# Altium schematic sheet 02_MCU_ESP32_WROOM.SchDoc
size 420 x 297 mm; SheetNumber: 3; SheetTotal: 3
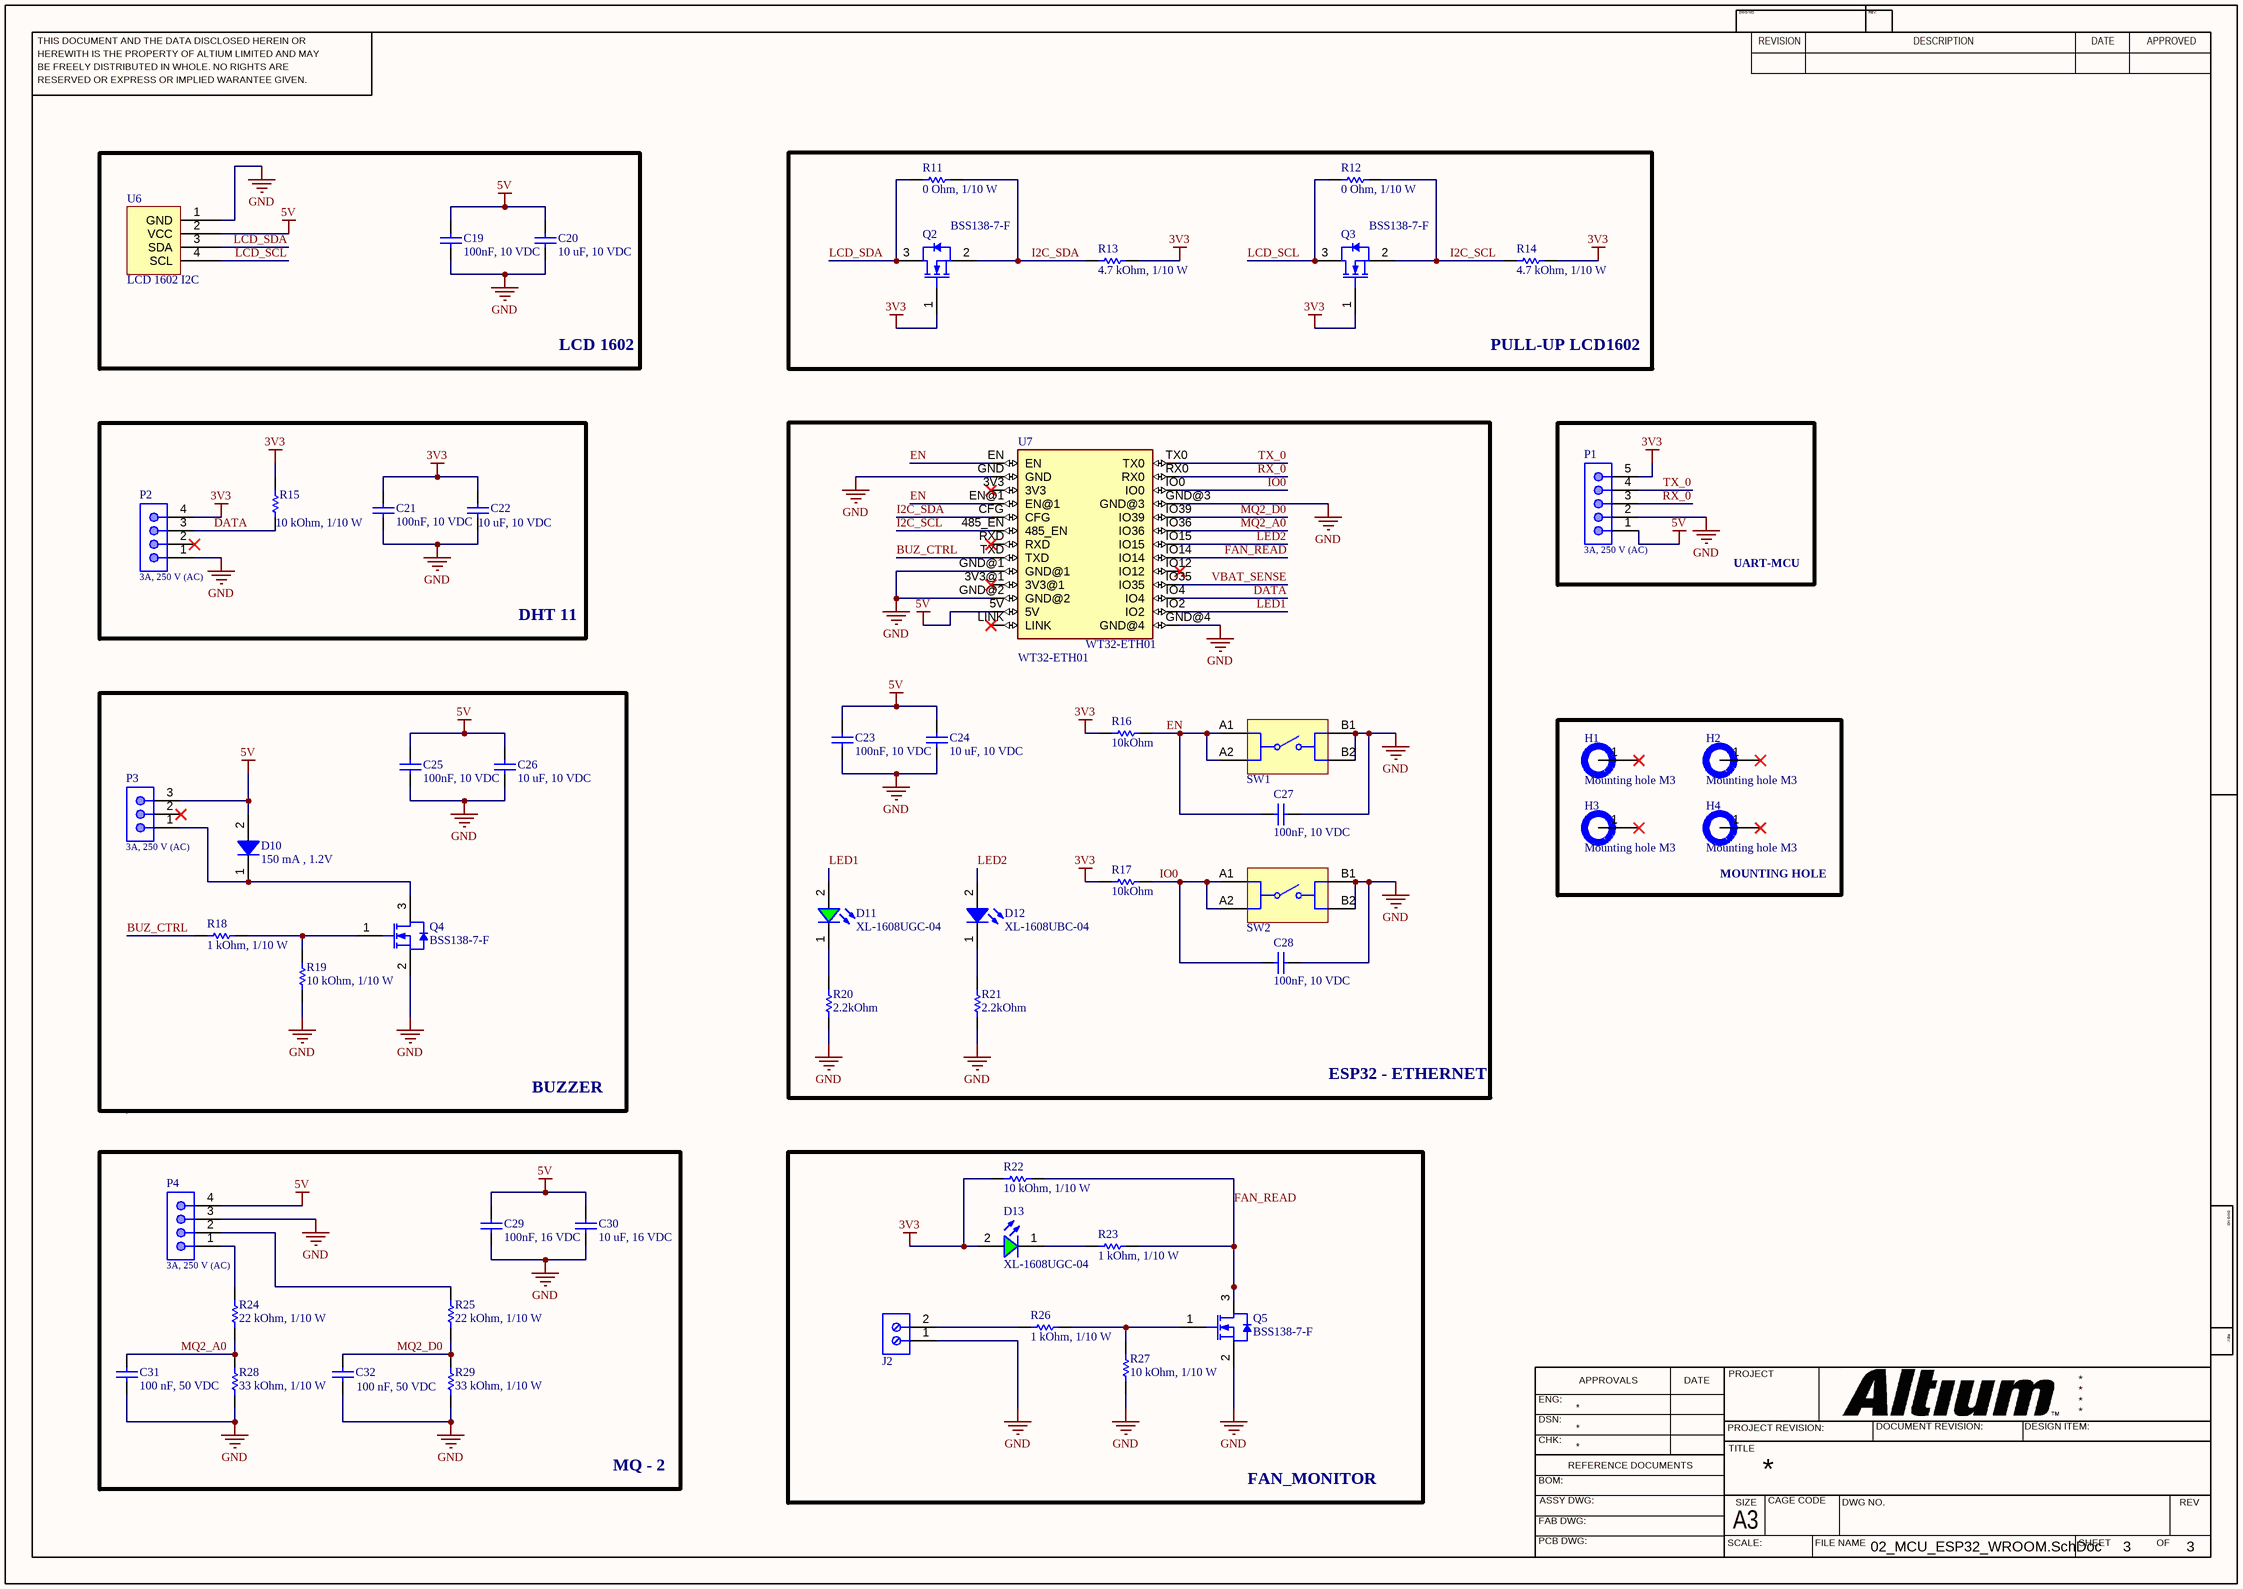
[diagram p0: 02_MCU_ESP32_WROOM.SchDoc]

## Parts
C19  100nF, 10 VDC  [CAP_0603]
C20  10 uF, 10 VDC  [CAP_0603]
C21  100nF, 10 VDC  [CAP_0603]
C22  10 uF, 10 VDC  [CAP_0603]
C23  100nF, 10 VDC  [CAP_0603]
C24  10 uF, 10 VDC  [CAP_0603]
C25  100nF, 10 VDC  [CAP_0603]
C26  10 uF, 10 VDC  [CAP_0603]
C27  100nF, 10 VDC  [CAP_0603]
C28  100nF, 10 VDC  [CAP_0603]
C29  100nF, 16 VDC  [CAP_0603]
C30  10 uF, 16 VDC  [CAP_0603]
C31  100 nF, 50 VDC  [CAP_0603]
C32  100 nF, 50 VDC  [CAP_0603]
D10  150 mA , 1.2V  [SOD-123]
D11  XL-1608UGC-04  [WL-SMCW_0603_H=0.7mm]
D12  XL-1608UBC-04  [WL-SMCW_0603_H=0.7mm]
D13  XL-1608UGC-04  [WL-SMCW_0603_H=0.7mm]
H1  Mounting hole M3  [Mounting hole M3]
H2  Mounting hole M3  [Mounting hole M3]
H3  Mounting hole M3  [Mounting hole M3]
H4  Mounting hole M3  [Mounting hole M3]
J2  6A, 150V  [691210910002]  (value not drawn)
P1  3A, 250 V (AC)  [61300511021]
P2  3A, 250 V (AC)  [61300411021]
P3  3A, 250 V (AC)  [61300311021]
P4  3A, 250 V (AC)  [61300411021]
Q2  BSS138-7-F  [BSS138-7-F-SOT23]
Q3  BSS138-7-F  [BSS138-7-F-SOT23]
Q4  BSS138-7-F  [BSS138-7-F-SOT23]
Q5  BSS138-7-F  [BSS138-7-F-SOT23]
R11  0 Ohm, 1/10 W  [RES_0603]
R12  0 Ohm, 1/10 W  [RES_0603]
R13  4.7 kOhm, 1/10 W  [RES_0603]
R14  4.7 kOhm, 1/10 W  [RES_0603]
R15  10 kOhm, 1/10 W  [RES_0603]
R16  10kOhm  [RES_0603]
R17  10kOhm  [RES_0603]
R18  1 kOhm, 1/10 W  [RES_0603]
R19  10 kOhm, 1/10 W  [RES_0603]
R20  2.2kOhm  [RES_0603]
R21  2.2kOhm  [RES_0603]
R22  10 kOhm, 1/10 W  [RES_0603]
R23  1 kOhm, 1/10 W  [RES_0603]
R24  22 kOhm, 1/10 W  [RES_0603]
R25  22 kOhm, 1/10 W  [RES_0603]
R26  1 kOhm, 1/10 W  [RES_0603]
R27  10 kOhm, 1/10 W  [RES_0603]
R28  33 kOhm, 1/10 W  [RES_0603]
R29  33 kOhm, 1/10 W  [RES_0603]
SW1  430152043826  [WS-TASV_L6W6H4.3_4301x20438x6]  (value not drawn)
SW2  430152043826  [WS-TASV_L6W6H4.3_4301x20438x6]  (value not drawn)
U6  LCD 1602 I2C  [*KK2_54X4]
U7  WT32-ETH01  [WT32-ETH01]

## Blocks framed on the sheet
LCD 1602: C19 C20 U6
PULL-UP LCD1602: Q2 Q3 R11-R14
DHT 11: C21 C22 P2 R15
ESP32 - ETHERNET: C23 C24 C27 C28 D11 D12 R16 R17 R20 R21 SW1 SW2 U7
UART-MCU: P1
BUZZER: C25 C26 D10 P3 Q4 R18 R19
MOUNTING HOLE: H1-H4
MQ - 2: C29-C32 P4 R24 R25 R28 R29
FAN_MONITOR: D13 J2 Q5 R22 R23 R26 R27

## Nets
3V3: C21.2 C22.2 D13.2(A) P1.5 P2.4 Q2.1(G) Q3.1(G) R13.1 R14.1 R15.2 R16.1 R17.1 R22.2
5V: C19.2 C20.2 C23.2 C24.2 C25.2 C26.2 C29.2 C30.2 D10.2(A) P1.1 P3.3 P4.4 U6.2(VCC) U7.5V
GND: C19.1 C20.1 C21.1 C22.1 C23.1 C24.1 C25.1 C26.1 C27.1 C28.1 C29.1 C30.1 C31.1 C32.1 J2.1 P1.2 P2.1 P4.3 Q4.2(S) Q5.2(S) R19.1 R20.2 R21.2 R27.1 R28.1 R29.1 SW1.B1 SW1.B2 SW2.B1 SW2.B2 U6.1(GND) U7.GND U7.GND@1 U7.GND@2 U7.GND@3 U7.GND@4
BUZ_CTRL: R18.1 U7.TXD
DATA: P2.3 R15.1 U7.IO4
EN: C27.2 R16.2 SW1.A1 SW1.A2 U7.EN U7.EN@1
FAN_READ: Q5.3(D) R22.1 R23.1 U7.IO14
I2C_SCL: Q3.2(S) R12.2 R14.2 U7.485_EN
I2C_SDA: Q2.2(S) R11.2 R13.2 U7.CFG
IO0: C28.2 R17.2 SW2.A1 SW2.A2 U7.IO0
LCD_SCL: Q3.3(D) R12.1 U6.4(SCL)
LCD_SDA: Q2.3(D) R11.1 U6.3(SDA)
LED1: D11.2(A) U7.IO2
LED2: D12.2(A) U7.IO15
MQ2_A0: C31.2 R24.2 R28.2 U7.IO36
MQ2_D0: C32.2 R25.1 R29.2 U7.IO39
RX_0: P1.3 U7.RX0
TX_0: P1.4 U7.TX0
VBAT_SENSE: U7.IO35
NetD10_1: D10.1(K) P3.1 Q4.3(D)
NetD11_1: D11.1(K) R20.1
NetD12_1: D12.1(K) R21.1
NetD13_1: D13.1(K) R23.2
NetJ2_2: J2.2 R26.1
NetP4_1: P4.1 R24.1
NetP4_2: P4.2 R25.2
NetQ4_1: Q4.1(G) R18.2 R19.2
NetQ5_1: Q5.1(G) R26.2 R27.2

Not connected (* = marked no-connect by the designer): H1 1*; H2 1*; H3 1*; H4 1*; P2 2*; P3 2*; U7 3V3* 3V3@1* IO12* LINK* RXD*

## Notes on the sheet
- THIS DOCUMENT AND THE DATA DISCLOSED HEREIN OR
- HEREWITH IS THE PROPERTY OF ALTIUM LIMITED AND MAY
- DWG NO:
- REVISION
- REV:
- DESCRIPTION
- DATE
- APPROVED
- BE FREELY DISTRIBUTED IN WHOLE. NO RIGHTS ARE
- RESERVED OR EXPRESS OR IMPLIED WARANTEE GIVEN.
- ENG:
- APPROVALS
- PROJECT
- DSN:
- CHK:
- REFERENCE DOCUMENTS
- PROJECT REVISION:
- TITLE
- DOCUMENT REVISION:
- DESIGN ITEM:
- BOM:
- FAB DWG:
- PCB DWG:
- ASSY DWG:
- SCALE:
- A3
- SIZE
- CAGE CODE
- FILE NAME
- DWG NO.
- SHEET
- OF
- REV

## Library data of the parts
C19-C30 = 0106031061010: CAP, size 0603, 10 uF, 10 VDC, 10%; Manufacturer: Samsung Electro-Mechanics; Manufacturer Part Number: CL10A106KP8NNNC; Capacitance: 10 uF; Tolerance: +/-10%; Voltage Rating DC: 10 VDC; Value: 10 uF; Packaging: Tape and Reel; Supplier 1 URL: https://www.mouser.vn/ProductDetail/Samsung-Electro-Mechanics/CL10A106KP8NNNC?qs=X6jEic%2FHinAlyfRHj7fKwg%3D%3D; Supplier 2 URL: https://www.digikey.com/en/products/detail/samsung-electro-mechanics/cl10a106kp8nnnc/3886850; Supplier 3 URL: https://www.thegioiic.com/tu-gom-0603-10uf-25v; Supplier 1: Mouser; Supplier 1 Part Number: 187-CL10A106KP8NNNC; Supplier 2: Digi-Key; Supplier 2 Part Number: 1276-1192-2-ND; Supplier 3: thegioiic; Supplier 3 Part Number: N/A; ComponentLink1Description: Datasheet; ComponentLink1URL: https://www.mouser.vn/datasheet/2/585/MLCC-1837944.pdf; Mount: SMD/SMT; Operating Temperature Max: + 85 C; Operating Temperature Min: - 40 C; Package / Case: 0603; LCSC Part #: C19702
C31 C32 = 0106031041050: CAP, size 0603, 100 nF, 50 VDC, 10%; Manufacturer: TDK; Manufacturer Part Number: CGA3E3X8R1H104K080AE; Capacitance: 100 nF; Tolerance: +/-10%; Voltage Rating DC: 50 VDC; Value: 100 nF; Packaging: Tape and Reel; Supplier 1 URL: https://www.mouser.com/ProductDetail/TDK/CGA3E3X8R1H104K080AE?qs=nQSIdc08i%252Bd8g3IRRgU2bw%3D%3D&utm_source=mouser-refine-download&utm_medium=file&utm_campaign=CGA3E3X8R1H104K080AE&utm_content=TDK; Supplier 2 URL: https://www.digikey.com/en/products/detail/tdk-corporation/cga3e3x8r1h104k080ae/5809262; Supplier 3 URL: https://www.thegioiic.com/tu-gom-0603-100nf-0-1uf-50v; Supplier 1: Mouser; Supplier 1 Part Number: 810-CGA3E3X8R1H104KA; Supplier 2: Digi-Key; Supplier 2 Part Number: 445-173697-2-ND; Supplier 3: thegioiic; Supplier 3 Part Number: N/A; ComponentLink1Description: Datasheet; ComponentLink1URL: https://product.tdk.com/system/files/dam/doc/product/capacitor/ceramic/mlcc/catalog/mlcc_automotive_soft_en.pdf?ref_disty=mouser; Mount: SMD/SMT; Operating Temperature Max: + 85 C; Operating Temperature Min: - 40 C; Package / Case: 0603; LCSC Part #: C14663
D10 = 1N4148W-E3-18: Diodes - General Purpose, Power, Switching 100 Volt 500mA 4ns; Manufacturer: Vishay Semiconductors; Type: Rectifiers; Forward Current: 150 mA; Maximum Diode Capacitance: 4 pF; Max Surge Current: 2 A; Peak Reverse Voltage: 100 V; Power Dissipation: 350 mW; Reverse Current: 5 uA; Supplier 1 URL: https://www.mouser.vn/ProductDetail/Vishay-Semiconductors/1N4148W-E3-18?qs=bTzheeSci6Q3YaBSBujcdg%3D%3D; Supplier 2 URL: https://www.digikey.com/en/products/detail/vishay-general-semiconductor-diodes-division/1n4148w-e3-18/3104163; Supplier 3 URL: https://www.thegioiic.com/1n4148w-e3-18-diode-gen-purp-75v-150ma-sod123; Value: 150 mA , 1.2V; Forward Voltage: 1.2 V; Recovery Time: 4 ns; Manufacturer Part Number: 1N4148W-E3-18; Supplier 1: Mouser; Supplier 1 Part Number: 78-1N4148W-E3-18; Supplier 2: Digi-Key; Supplier 2 Part Number: 1N4148W-E3-18TR-ND; Supplier 3: thegioiic; Supplier 3 Part Number: 1N4148W-E3-18; Mount: SMD/SMT; Operating Temperature Max: + 85 C; Operating Temperature Min: - 40 C; Package / Case: SOD-123; ComponentLink1Description: Datasheet; ComponentLink1URL: https://www.vishay.com/doc?85748; Packaging: Tape and Reel; LCSC Part #: N/A
D11 D13 = XL-1608UGC-04: Emerald Green 525nm LED Indication - Discrete 3.3V 0603; Manufacturer: XINGLIGHT; Type: Clear; Color: Green; ComponentLink1Description: Datasheet; ComponentLink1URL: https://www.lcsc.com/datasheet/C965807.pdf; Supplier 1 URL: N/A; Supplier 2 URL: N/A; Supplier 3 URL: https://www.thegioiic.com/led-xanh-la-0603-dan-smd-trong-suot; Value: XL-1608UGC-04; Mount: SMD/SMT; Operating Temperature Max: + 85 C; Operating Temperature Min: - 40 C; Package / Case: 0603; Packaging: Tape and Reel; Supplier 1: Mouser; Supplier 1 Part Number: N/A; Supplier 2: Digi-Key; Supplier 2 Part Number: N/A; Supplier 3: thegioiic; Supplier 3 Part Number: N/A; LCSC Part #: C965804; Manufacturer Part Number: XL-1608UGC-04
D12 = XL-1608UBC-04: Blue 470nm LED Indication - Discrete 3.3V 0603; Manufacturer: XINGLIGHT; Type: Clear; Color: Blue; ComponentLink1Description: Datasheet; ComponentLink1URL: https://www.lcsc.com/datasheet/C965807.pdf; Supplier 1 URL: N/A; Supplier 2 URL: N/A; Supplier 3 URL: https://www.thegioiic.com/led-xanh-duong-0603-dan-smd-trong-suot; Value: XL-1608UBC-04; Manufacturer Part Number: XL-1608UBC-04; Mount: SMD/SMT; Operating Temperature Max: + 85 C; Operating Temperature Min: - 40 C; Package / Case: 0603; Packaging: Tape and Reel; Supplier 1: Mouser; Supplier 1 Part Number: N/A; Supplier 2: Digi-Key; Supplier 2 Part Number: N/A; Supplier 3: thegioiic; Supplier 3 Part Number: N/A; LCSC Part #: C965807
J2 = 691210910002: WR-TBL Series 2109 Horizontal Entry, THT, pitch 2.54mm, 2p; Manufacturer: Wurth Elektronik; Modularity: No; ComponentLink1Description: Datasheet; ComponentLink1URL: https://www.we-online.com/redexpert/spec/691210910002?ad; Manufacturer Part Number: 691210910002; Category: Terminal Blocks; Match Code: WR-TBL; Mount: Through Hole; Operating Temperature Max: 105°C; Operating Temperature Min: -40°C; Packaging: Box; Application: Rising Cage Clamp; Number of Pins: 2; Number of Rows: 1; Orientation: Horizontal; Pitch: 2.54mm; Rated Current: 6A; Working Voltage: 150V; Supplier 1 URL: N/A; Supplier 2 URL: N/A; Supplier 3 URL: https://www.thegioiic.com/kf128-2-v-domino-2-chan-thang-2-54mm-150v-6a-han-pcb; Value: 6A, 150V; LCSC Part #: N/A; Supplier 1: Mouser; Supplier 1 Part Number: N/A; Supplier 2: Digi-Key; Supplier 2 Part Number: N/A; Supplier 3: thegioiic; Supplier 3 Part Number: N/A
P1 = 61300511021: WR-PHD Pin Header, THT, pitch 2.54mm, Single Row, Angled, 5p; Manufacturer: Wurth Elektronik; Pin Number: 5; Working Voltage: 250VAC; Withstanding Voltage: 500VAC; Contact Resistance: 20mOhm; ComponentLink1Description: Datasheet; ComponentLink1URL: https://www.we-online.com/catalog/datasheet/61300511021.pdf; Manufacturer Part Number: 61300511021; Pitch: 2.54mm; Packaging: Bag; Gender: Pin Header; Rated Current: 3A; Row Number: Single; Orientation: Angled; Supplier 1 URL: https://www.mouser.vn/ProductDetail/Wurth-Elektronik/61300511021?qs=PhR8RmCirEazneNRFf2Thg%3D%3D; Supplier 2 URL: N/A; Supplier 3 URL: N/A; LCSC Part #: N/A; Mount: THT; Operating Temperature Max: + 85 C; Operating Temperature Min: - 25 C; Supplier 1: Mouser; Supplier 1 Part Number: 710-61300511021; Supplier 2: Digi-Key; Supplier 2 Part Number: N/A; Supplier 3: thegioiic; Supplier 3 Part Number: N/A; Value: 3A, 250 V (AC)
P2 P4 = 61300411021: WR-PHD Pin Header, THT, pitch 2.54mm, Single Row, Angled, 4p; Manufacturer: Wurth Elektronik; Pin Number: 4; Working Voltage: 250VAC; Withstanding Voltage: 500VAC; Contact Resistance: 20mOhm; ComponentLink1Description: Datasheet; ComponentLink1URL: https://www.we-online.com/catalog/datasheet/61300411021.pdf; Manufacturer Part Number: 61300411021; Pitch: 2.54mm; Packaging: Bag; Gender: Pin Header; Rated Current: 3A; Row Number: Single; Orientation: Angled; Supplier 1 URL: https://www.mouser.vn/ProductDetail/Wurth-Elektronik/61300411021?qs=PhR8RmCirEZA1t3zcLZqlA%3D%3D; Supplier 2 URL: N/A; Supplier 3 URL: N/A; LCSC Part #: N/A; Mount: THT; Operating Temperature Max: + 85 C; Operating Temperature Min: - 25 C; Supplier 1: Mouser; Supplier 1 Part Number: 710-61300411021; Supplier 2: Digi-Key; Supplier 2 Part Number: N/A; Supplier 3: thegioiic; Supplier 3 Part Number: N/A; Value: 3A, 250 V (AC)
P3 = 61300311021: WR-PHD Pin Header, THT, pitch 2.54mm, Single Row, Angled, 3p; Manufacturer: Wurth Elektronik; Pin Number: 3; Working Voltage: 250VAC; Withstanding Voltage: 500VAC; Contact Resistance: 20mOhm; ComponentLink1Description: Datasheet; ComponentLink1URL: https://www.we-online.com/catalog/datasheet/61300311021.pdf; Manufacturer Part Number: 61300311021; Pitch: 2.54mm; Packaging: Bag; Gender: Pin Header; Rated Current: 3A; Row Number: Single; Orientation: Angled; Supplier 1 URL: https://www.mouser.vn/ProductDetail/Wurth-Elektronik/61300311021?qs=PhR8RmCirEbNJ%252BPpVpFqFw%3D%3D; Supplier 2 URL: N/A; Supplier 3 URL: N/A; LCSC Part #: N/A; Mount: THT; Operating Temperature Max: + 85 C; Operating Temperature Min: - 25 C; Supplier 1: Mouser; Supplier 1 Part Number: 710-61300311021; Supplier 2: Digi-Key; Supplier 2 Part Number: N/A; Supplier 3: thegioiic; Supplier 3 Part Number: N/A; Value: 3A, 250 V (AC)
Q2-Q5 = BSS138-7-F: MOSFETs 300mW 50V DSS; Manufacturer: Diodes Incorporated; Continuous Drain Current: 200 mA; Drain-to-Source On-Resistance: 3.5 Ohms; FET Type: N-Channel; Gate-to-Source Voltage (VGS): ±20V; Gate Threshold Voltage (Vth): 1.2 V; Drain to Source Voltage (Vdss): 50 V; Power Dissipation: 300 mW; Total Gate Charge: N/A; ComponentLink1Description: Datasheet; ComponentLink1URL: https://www.mouser.com/datasheet/2/115/ds30144-3214779.pdf; Supplier 1 URL: https://www.mouser.com/ProductDetail/Diodes-Incorporated/BSS138-7-F?qs=TJSU9qitBVRAP5gIAnNy0g%3D%3D; Supplier 2 URL: https://www.digikey.com/en/products/detail/diodes-incorporated/BSS138-7-F/717723; Supplier 3 URL: N/A; Value: BSS138-7-F; Manufacturer Part Number: BSS138-7-F; Mount: SMD/SMT; Operating Temperature Max: + 150 C; Operating Temperature Min: - 50 C; Package / Case: SOT-23-3; Packaging: Tape and Reel; Supplier 1: Mouser; Supplier 1 Part Number: 621-BSS138-7-F; Supplier 2: Digi-Key; Supplier 2 Part Number: BSS138-FDITR-ND; Supplier 3: thegioiic; Supplier 3 Part Number: N/A; LCSC Part #: C40912
R11 R12 = 0006030001: RES, size 0603, 0 Ohm, 1/10 W, 1%; Manufacturer: YAGEO; Manufacturer Part Number: AC0603FR-070RL; Resistance: 0 Ohm; Rated Power: 1/10 W; Value: 0 Ohm; Tolerance: +/-1%; Supplier 1 URL: https://www.mouser.com/ProductDetail/YAGEO/AC0603FR-070RL?qs=sGAEpiMZZMtlubZbdhIBIOG3KwTtqrl%2FD2D%252BGuMCfoY%3D; Supplier 3 URL: https://www.thegioiic.com/dien-tro-0-ohm-0603-1-; Supplier 2 URL: https://www.digikey.com/en/products/detail/yageo/ac0603fr-070rl/2827812; Packaging: Tape and Reel; Supplier 1: Mouser; Supplier 1 Part Number: 603-AC0603FR-070RL; Supplier 2: Digi-Key; Supplier 2 Part Number: 311-0.0LDTR-ND; Supplier 3: thegioiic; Supplier 3 Part Number: N/A; ComponentLink1Description: Datasheet; ComponentLink1URL: https://www.mouser.com/datasheet/2/447/Yageo_06282023_ACseries-3224032.pdf; Mount: SMD/SMT; Operating Temperature Max: + 85 C; Operating Temperature Min: - 40 C; Package / Case: 0603; LCSC Part #: C192909
R13 R14 = 0006034721: RES, size 0603, 4.7 kOhm, 1/10 W, 1%; Manufacturer: YAGEO; Manufacturer Part Number: RC0603FR-074K7L; Rated Power: 1/10 W; Tolerance: +/-1%; Resistance: 4.7 kOhm; Supplier 1 URL: https://www.mouser.vn/ProductDetail/YAGEO/RC0603FR-074K7L?qs=gt6vzsuosg37y0l7Vt36bQ%3D%3D; Supplier 3 URL: N/A; Value: 4.7 kOhm; Supplier 2 URL: N/A; Packaging: Tape and Reel; Supplier 1: Mouser; Supplier 1 Part Number: 603-RC0603FR-074K7L; Supplier 2: Digi-Key; Supplier 2 Part Number: N/A; Supplier 3: thegioiic; Supplier 3 Part Number: N/A; ComponentLink1Description: Datasheet; ComponentLink1URL: https://www.mouser.vn/datasheet/2/447/YAGEO_PYu_RC_Group_51_RoHS_L_12-3313492.pdf; Mount: SMD/SMT; Operating Temperature Max: + 85 C; Operating Temperature Min: - 40 C; Package / Case: 0603; LCSC Part #: C99782
R15 R19 R27 = 0006031031: RES, size 0603, 10 kOhm, 1/10 W, 1%; Manufacturer: YAGEO; Manufacturer Part Number: RC0603FR-0710KL; Resistance: 10 kOhm; Rated Power: 1/10 W; Value: 10 kOhm; Tolerance: +/-1%; Supplier 1 URL: N/A; Supplier 3 URL: https://www.thegioiic.com/dien-tro-10-kohm-0603-1-; Supplier 2 URL: https://www.digikey.com/en/products/detail/yageo/rc0603fr-0710kl/726880; Packaging: Tape and Reel; Supplier 1: Mouser; Supplier 1 Part Number: N/A; Supplier 2: Digi-Key; Supplier 2 Part Number: 311-10.0KHRTR-ND; Supplier 3: thegioiic; Supplier 3 Part Number: N/A; ComponentLink1Description: Datasheet; ComponentLink1URL: https://fscdn.rohm.com/en/products/databook/datasheet/passive/resistor/chip_resistor/esr-e.pdf; Mount: SMD/SMT; Operating Temperature Max: + 85 C; Operating Temperature Min: - 40 C; Package / Case: 0603; LCSC Part #: C98220
R16 R17 R20 R21 = 0006033011: RES, size 0603, 300 Ohm, 1/10 W, 1%; Manufacturer: OEM; Rated Power: 1/10 W; Resistance: 300 Ohm; Value: 300 Ohm; Tolerance: +/-1%; Supplier 1 URL: https://www.mouser.vn/ProductDetail/ROHM-Semiconductor/SDR03EZPF3000?qs=MyNHzdoqoQKYsGXohuNk8Q%3D%3D; Supplier 3 URL: N/A; Supplier 2 URL: https://www.digikey.com/en/products/detail/yageo/RC0603FR-10300RL/14008461; Packaging: Tape and Reel; Supplier 1: Mouser; Supplier 1 Part Number: 755-SDR03EZPF3000; Supplier 2: Digi-Key; Supplier 2 Part Number: 13-RC0603FR-10300RLTR-ND; Supplier 3: thegioiic; Supplier 3 Part Number: N/A; Manufacturer Part Number: OEM; ComponentLink1Description: Datasheet; ComponentLink1URL: N/A; Mount: SMD/SMT; Operating Temperature Max: + 85 C; Operating Temperature Min: - 40 C; Package / Case: 0603; LCSC Part #: N/A
R18 R22 R23 R26 = 0006031021: RES, size 0603, 1 kOhm, 1/10 W, 1%; Manufacturer: YAGEO; Manufacturer Part Number: RC0603FR-071KL; Resistance: 1 kOhm; Rated Power: 1/10 W; Value: 1 kOhm; Tolerance: +/-1%; Supplier 1 URL: https://www.mouser.vn/ProductDetail/YAGEO/RC0603FR-071KL?qs=VU8sRB4EgwApHsk4rF%2F3zg%3D%3D; Supplier 3 URL: N/A; Supplier 2 URL: https://www.digikey.com/en/products/detail/yageo/rc0603fr-071kl/726843; Packaging: Tape and Reel; Supplier 1: Mouser; Supplier 1 Part Number: 603-RC0603FR-071KL; Supplier 2: Digi-Key; Supplier 2 Part Number: 311-1.00KHRTR-ND; Supplier 3: thegioiic; Supplier 3 Part Number: N/A; ComponentLink1Description: Datasheet; ComponentLink1URL: https://www.yageo.com/upload/media/product/productsearch/datasheet/rchip/PYu-SR_20105_RoHS_L_10.pdf; Mount: SMD/SMT; Operating Temperature Max: + 85 C; Operating Temperature Min: - 40 C; Package / Case: 0603; LCSC Part #: C22548
R24 R25 = 0006032235: RES, size 0603, 22 kOhm, 1/10 W, 5%; Manufacturer: YAGEO; Manufacturer Part Number: RC0603FR-0722KL; Rated Power: 1/10 W; Resistance: 22 kOhm; Value: 22 kOhm; Tolerance: +/-5%; Supplier 1 URL: https://www.mouser.vn/ProductDetail/YAGEO/RC0603FR-0722KL?qs=diQw95jMAeO86nsIZoklhA%3D%3D; Supplier 3 URL: https://www.thegioiic.com/dien-tro-22-kohm-0603-5; Supplier 2 URL: https://www.digikey.com/en/products/detail/yageo/rc0603fr-0722kl/727056; Packaging: Tape and Reel; Supplier 1: Mouser; Supplier 1 Part Number: 603-RC0603FR-0722KL; Supplier 2: Digi-Key; Supplier 2 Part Number: 311-22.0KHRTR-ND; Supplier 3: thegioiic; Supplier 3 Part Number: N/A; ComponentLink1Description: Datasheet; ComponentLink1URL: https://www.mouser.vn/datasheet/2/315/Panasonic_Resistors_Thick_Film_Anti_Sulf_Anti_Surg-1825099.pdf; Mount: SMD/SMT; Operating Temperature Max: + 85 C; Operating Temperature Min: - 40 C; Package / Case: 0603; LCSC Part #: C114065
R28 R29 = 0006033835: RES, size 0603, 38 kOhm, 1/10 W, 5%; Manufacturer: OEM; Rated Power: 1/10 W; Resistance: 38 kOhm; Value: 38 kOhm; Tolerance: +/-5%; Supplier 1 URL: N/A; Supplier 3 URL: N/A; Supplier 2 URL: N/A; Packaging: Tape and Reel; Supplier 1: Mouser; Supplier 1 Part Number: N/A; Supplier 2: Digi-Key; Supplier 2 Part Number: N/A; Supplier 3: thegioiic; Supplier 3 Part Number: N/A; Manufacturer Part Number: OEM; ComponentLink1Description: Datasheet; ComponentLink1URL: N/A; Mount: SMD/SMT; Operating Temperature Max: + 85 C; Operating Temperature Min: - 40 C; Package / Case: 0603; LCSC Part #: N/A
SW1 SW2 = 430152043826: WS-TASV SMT Tact Switch, L6 x W6 x H4.3mm, 260g, SPST-NO, 12V, 50mA; Manufacturer: Wurth Elektronik; Washable: No; Rated Voltage: 12VDC; Manufacturer Part Number: 430152043826; Category: Tact Switches; Match Code: WS-TASV; Mount: Surface Mount; Operating Temperature Max: 85°C; Operating Temperature Min: -40°C; Packaging: Tape and Reel; Length: 6mm; Width: 6mm; Height: 4.3mm; Circuit: SPST-NO; Contact Material: Stainless Steel; Operation Force: 260g; Rated Current: 50mA; Terminal Material: Copper Alloy; Terminal Plating: Silver; Supplier 1 URL: https://www.mouser.vn/ProductDetail/Wurth-Elektronik/430152043826?qs=wr8lucFkNMUjBcFj1giTsA%3D%3D; Supplier 2 URL: https://www.digikey.com/en/products/detail/w%C3%BCrth-elektronik/430152043826/5208994; Supplier 3 URL: https://www.thegioiic.com/nut-nhan-6x6mm-cao-4-3mm-4-chan-smd; LCSC Part #: N/A; ComponentLink1Description: Datasheet; ComponentLink1URL: https://www.we-online.com/redexpert/spec/430152043826?ad; Package / Case: 0805; Supplier 1: Mouser; Supplier 1 Part Number: 710-430152043826; Supplier 2: Digi-Key; Supplier 2 Part Number: 732-6991-2-ND; Supplier 3: thegioiic; Supplier 3 Part Number: OEM; Value: 430152043826
U7 = WT32-ETH01: Embedded serial port to Ethernet module; MF: wireless-tag; SnapEDA_Link: https://www.snapeda.com/parts/WT32-ETH01/Wireless-Tag/view-part/?ref=snap; Package: None; Value: *; MP: WT32-ETH01; Check_prices: https://www.snapeda.com/parts/WT32-ETH01/Wireless-Tag/view-part/?ref=eda